# Altium project Karta_Radiowa_ILS_TETRA.PrjPcb (part 5 of 9)

## Sheet TOR ILS.SchDoc: 110 MHz
size A3; SheetNumber: 14; SheetTotal: 17
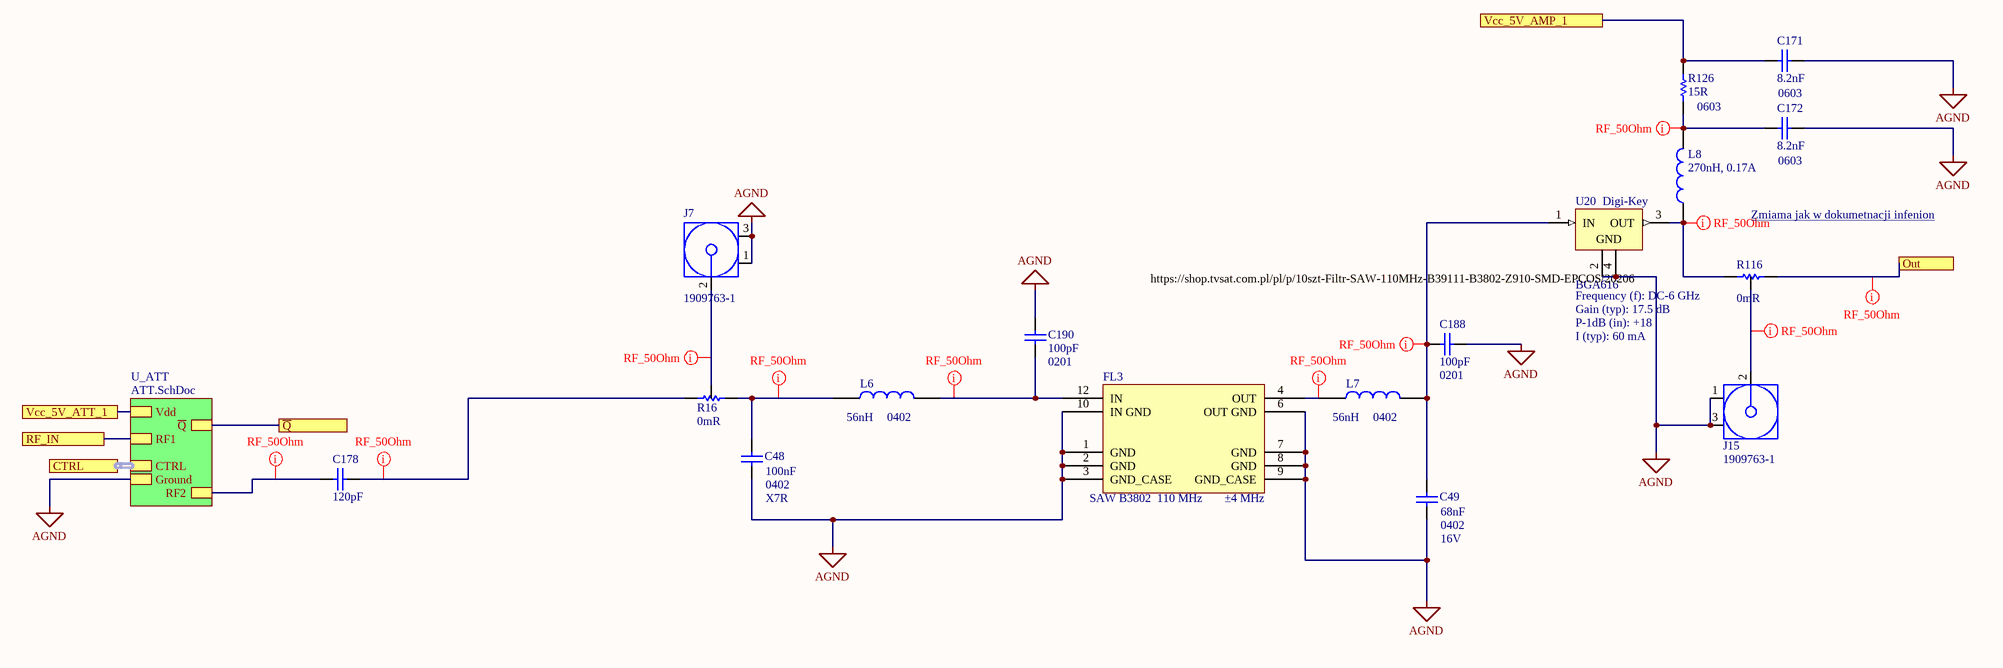
[diagram p6: TOR ILS.SchDoc]

### Parts
C48  100nF  Case/Package: 0402  Dielectric: X7R  [CAP 0402/1005 RF KK]
C49  68nF  Case/Package: 0402  Voltage Rating: 16V  [CAP 0402/1005 RF KK]
C171  8.2nF  Case/Package: 0603  [CAP 0603/1608 RF]
C172  8.2nF  Case/Package: 0603  [CAP 0603/1608 RF]
C178  120pF  [CAP 0402/1005 RF KK]
C188  100pF  Case/Package: 0201  [CAP 0201/0603 KK]
C190  100pF  Case/Package: 0201  [CAP 0201/0603 KK]
FL3  SAW B3802  Bandwidth: ±4 MHz  Center frequency: 110 MHz  [QCC12B]
J7  1909763-1  [TECO-1909763-1_V]
J15  1909763-1  [TECO-1909763-1_V]
L6  56nH  Case/Package: 0402  [FB0402]
L7  56nH  Case/Package: 0402  [FB0402]
L8  270nH, 0.17A  [WE-KI_0603]
R16  0mR  [RES 0402/1005 RF - 3-PADS]
R116  0mR  [RES 0402/1005 RF - 3-PADS]
R126  15R  Case/Package: 0603  [RES 0603/1608 RF]
U20  BGA616  Frequency (f): DC-6 GHz  Gain (typ): 17.5 dB  I (typ): 60 mA  P-1dB (in): +18  Supplier 2: Digi-Key  [INF-SOT343_V]

### Sub-sheets
U_ATT = ATT.SchDoc: Vdd, Ground, RF1, RF2, CTRL (harness ATT_Controle), ~{Q}

### Ports
CTRL, Out, RF_IN, Vcc_5V_AMP_1, Vcc_5V_ATT_1, ~{Q}

### Nets
AGND: C48.1 C49.1 C171.2 C172.2 C188.1 C190.1 FL3.1(GND) FL3.2(GND) FL3.3(GND_CASE) FL3.6(OUT_GND) FL3.7(GND) FL3.8(GND) FL3.9(GND_CASE) FL3.10(IN_GND) J7.1 J7.3 J15.1 J15.3 U20.2(GND) U20.4(GND) ; sheet U_ATT/Ground  [project net GND_ATT]
~{Q}: port ~{Q}, sheet U_ATT/~{Q}
Vcc_5V_AMP_1: C171.1 R126.2 ; port Vcc_5V_AMP_1
Vcc_5V_ATT_1: port Vcc_5V_ATT_1, sheet U_ATT/Vdd
NetC48_2: C48.2 L6.1 R16.2
NetC49_2: C49.2 C188.2 L7.2 U20.1(IN)
NetC172_1: C172.1 L8.2 R126.1
NetC175_2: R116.1 ; port Out
NetC178_1: C178.1 ; sheet U_ATT/RF2
NetC178_2: C178.2 R16.1
NetC190_2: C190.2 FL3.12(IN) L6.2
NetFL3_4: FL3.4(OUT) L7.1
NetJ7_2: J7.2 R16.3
NetJ15_2: J15.2 R116.3
NetL8_1: L8.1 R116.2 U20.3(OUT)
NetR9_U_RF_ANT_L_2: port RF_IN, sheet U_ATT/RF1

### Buses and harness runs
harness port CTRL = sheet U_ATT/CTRL

### Layout directives
net class Single50: NetC48_2, NetC49_2, NetC172_1, NetC175_2, NetC178_1, NetC178_2, NetC190_2, NetFL3_4, NetJ7_2, NetJ15_2, NetL8_1

### Notes on the sheet
- Zmiama jak w dokumetnacji infenion <https://www.infineon.com/dgdl/AN098.pdf?fileId=db3a30431441fb5d0114b6641c751744>
- https://shop.tvsat.com.pl/pl/p/10szt-Filtr-SAW-110MHz-B39111-B3802-Z910-SMD-EPCOS/20206
- Title
- Size:
- Date:
- A3
- Number:
- Time:
- Revision:
- Sheet
- of
- File:

### Library data of the parts
C48 = Capacitor: 0402 16V X7R 0.1uF 5% multilayer ceramic capacitor; Manufacturer: Murata; Manufacturer Part Number: GCM155R71C104JA55D; Supplier 1: Digi-Key; Supplier Part Number 1: 490-16433-1-ND; RoHS: Yes; Category: Ceramic Capacitors; Stock 1: 306728; Pricing 1: 1=0,10000, 10=0,05500, 50=0,02980, 100=0,02430, 500=0,01734, 1000=0,01363, 2500=0,01239, 5000=0,01140 (USD); Min Operating Temperature: -55°C; Max Operating Temperature: 125°C; Capacitance: 100nF; Tolerance: 5%; Packaging: Tape and Reel; Length: 1mm; Depth: 0.5mm; ComponentLink1URL: http://components.arrow.com/part/dataview/0323_06691671?src-supplier=Arrow+Europe; ComponentLink1Description: http://components.arrow.com/part/dataview/0323_06691671?src-supplier=Arrow+Europe; ComponentLink2URL: http://search.murata.co.jp/Ceramy/image/img/A01X/G101/ENG/GCM155R71C104JA55-01.pdf?src-supplier=Digi-Key; ComponentLink2Description: http://search.murata.co.jp/Ceramy/image/img/A01X/G101/ENG/GCM155R71C104JA55-01.pdf?src-supplier=Digi-Key; ComponentLink3URL: https://search.murata.co.jp/Ceramy/image/img/A01X/G101/ENG/GCM155R71C104JA55-01.pdf?src-supplier=Digi-Key; ComponentLink3Description: https://search.murata.co.jp/Ceramy/image/img/A01X/G101/ENG/GCM155R71C104JA55-01.pdf?src-supplier=Digi-Key
C49 = Capacitor: CAP CER 0.068UF 16V X7R 0402; Manufacturer: Yageo; Manufacturer Part Number: AC0402KRX7R7BB683; Tolerance: 10%; Supplier 1: Digi-Key; Supplier Part Number 1: 311-3269-1-ND; RoHS: No; Category: Ceramic Capacitors; Stock 1: 93171; Pricing 1: 1=0,10000, 10=0,06000, 50=0,03260, 100=0,02650, 500=0,01896, 1000=0,01490, 2500=0,01354, 5000=0,01246 (USD); Mount: Surface Mount; Min Operating Temperature: -55°C; Max Operating Temperature: 125°C; Packaging: Cut Tape; Capacitance: 68nF; Ratings: AEC-Q200; Lead Free: Lead Free; ComponentLink1URL: http://www.yageo.com/documents/recent/UPY-AC_NP0X7R_16V-to-630V_12.pdf?src-supplier=Digi-Key; ComponentLink1Description: http://www.yageo.com/documents/recent/UPY-AC_NP0X7R_16V-to-630V_12.pdf?src-supplier=Digi-Key; ComponentLink2URL: http://www.yageo.com/documents/recent/UPY-AC_NP0X7R_16V-to-630V_11.pdf?src-supplier=Digi-Key; ComponentLink2Description: http://www.yageo.com/documents/recent/UPY-AC_NP0X7R_16V-to-630V_11.pdf?src-supplier=Digi-Key
C171 C172 = Capacitor: Multilayer Ceramic Capacitors MLCC - SMD/SMT 0603 8,200pF 50volts C0G +/-5%; Manufacturer: Murata; Manufacturer Part Number: GRM1885C1H822JA01D; Voltage Rating: 50V; Tolerance: 5%; Supplier 1: Digi-Key; Supplier Part Number 1: 490-11482-1-ND; RoHS: Yes; Category: Ceramic Capacitors; Stock 1: 65615; Pricing 1: 1=0,21000, 10=0,14200, 50=0,08500, 100=0,07170, 500=0,04908, 1000=0,04341 (USD); Mount: Surface Mount; Case Code (Imperial): 0603; Case Code (Metric): 1608; Min Operating Temperature: -55°C; Max Operating Temperature: 125°C; Dielectric: C0G; Capacitance: 8.2nF; Voltage Rating (DC): 50V; Packaging: Tape and Reel; Package Quantity: 4000; Termination: SMD/SMT; Length: 0.063inch; Height: 0.8mm; Width: 0.031inch; Thickness: 0.035inch; ComponentLink1URL: https://datasheet.ciiva.com/29537/partnumbering-e-01-29537913.pdf?src-supplier=Digi-Key; ComponentLink1Description: https://datasheet.ciiva.com/29537/partnumbering-e-01-29537913.pdf?src-supplier=Digi-Key
C178 = Capacitor: CAP CER 120PF 25V C0G/NP0 0402; Manufacturer: KEMET; Manufacturer Part Number: C0402C121J3GAC7867; Tolerance: 5%; Supplier 1: Digi-Key; Supplier Part Number 1: 399-14880-1-ND; RoHS: No; Category: Ceramic Capacitors; Stock 1: 43311; Pricing 1: 1=0,10000, 10=0,04100, 50=0,02260, 100=0,01840, 500=0,01312, 1000=0,01032, 2500=0,00938, 5000=0,00863 (USD); Mount: Surface Mount; Case/Package: 0402; Case Code (Imperial): 0402; Case Code (Metric): 1005; Min Operating Temperature: -55°C; Max Operating Temperature: 125°C; Packaging: Tape and Reel; Capacitance: 120pF; Voltage Rating: 25V; ComponentLink1URL: https://api.kemet.com/component-edge/download/datasheet/C0402C121J3GAC7867.pdf?src-supplier=Digi-Key; ComponentLink1Description: https://api.kemet.com/component-edge/download/datasheet/C0402C121J3GAC7867.pdf?src-supplier=Digi-Key
C188 C190 = Capacitor: Multilayer Ceramic Capacitors MLCC - SMD/SMT 0201 100pF 25volts C0G +/-5%; Manufacturer: Murata; Manufacturer Part Number: GRM0335C1E101JA01D; Tolerance: 5%; Voltage: 25V; Supplier 1: Digi-Key; Supplier Part Number 1: 490-3160-1-ND; RoHS: Yes; Category: Ceramic Capacitors; Stock 1: 270262; Pricing 1: 1=0,10000, 10=0,01300, 100=0,00560, 500=0,00400, 1000=0,00315, 2500=0,00286, 5000=0,00263 (USD); Mount: Surface Mount; Case Code (Metric): 0603; Case Code (Imperial): 0201; Min Operating Temperature: -55°C; Max Operating Temperature: 125°C; Dielectric: C0G; Capacitance: 100pF; Termination: SMD/SMT; Package Quantity: 15000; Packaging: Tape and Reel; Voltage Rating: 25V; Voltage Rating (DC): 25V; Length: 0.6mm; Height: 0.3mm; Thickness: 0.013inch; Depth: 0.3mm; Width: 0.012inch; Radiation Hardening: No; REACH SVHC: No SVHC; Lead Free: Lead Free; ComponentLink1URL: https://datasheet.ciiva.com/16497/grm0335c1e101ja01-01-16497112.pdf?src-supplier=Future+Electronics; ComponentLink1Description: https://datasheet.ciiva.com/16497/grm0335c1e101ja01-01-16497112.pdf?src-supplier=Future+Electronics; ComponentLink2URL: https://datasheet.ciiva.com/18697/product-18697797.pdf?src-supplier=Digi-Key; ComponentLink2Description: https://datasheet.ciiva.com/18697/product-18697797.pdf?src-supplier=Digi-Key
FL3 = SAW B3802: Low-Loss Filter 110,0 MHz / TYPE: B3802 / Ordering Code: B39111-B3802-Z910; Source Power: 10 dBm; ComponentLink1Description: Datasheet; ComponentLink1URL: https://www.tvsat.com.pl/pdf/B/b39111-b3802_epc.pdf; ComponentLink2Description: Supplier; ComponentLink2URL: https://shop.tvsat.com.pl/pl/p/10szt-Filtr-SAW-110MHz-B39111-B3802-Z910-SMD-EPCOS/20206
J7 J15 = 1909763-1: Ultra Miniature Coaxial Connector Jack, 60 V, 50 Ohm, -40 to 90 degC, RoHS, Tape and Reel; Brand: TE Connectivity / AMP; Maximum Frequency: 6 GHz; Gender: Jack (Female); Body Material: Liquid Crystal Polymer (LCP); RF Series: UMCC; Impedance: 50 Ohms; DatasheetVersion: Rev. B2; PackageReference: SMD; PackageDescription: 3-Pin Surface Mount Device, Body 2.6 x 2.6 mm; Supplier 1: Newark; Supplier Part Number 1: 62X0488; Supplier 2: Farnell; Supplier Part Number 2: 2781689; Supplier 3: Digi-Key; Supplier Part Number 3: A118077TR-ND; Supplier 4: Digi-Key; Supplier Part Number 4: A118077CT-ND; Supplier 5: Digi-Key; Supplier Part Number 5: A118077DKR-ND; Product Category: RF Connectors / Coaxial Connectors; Packaging: Reel; Product: Connectors; Orientation: Straight; Operating Temperature Range: - 40 C to + 90 C; Factory Pack Quantity: 5000; RoHS: Details; Contact Plating: Gold; Contact Material: Copper Alloy; Mounting Technology: Surface Mount; ComponentLink1Description: Manufacturer URL; ComponentLink1URL: http://www.te.com; ComponentLink2Description: Datasheet; ComponentLink2URL: http://www.te.com/commerce/DocumentDelivery/DDEController?Action=srchrtrv&DocNm=1909763&DocType=Customer+Drawing&DocLang=English
L6 L7 = Inductor: MURATA - LQW15AN56NJ00D - High Frequency Inductor, 56 nH, LQW15AN_00 Series, 200 mA, 0402 [1005 Metric], Unshielded, 1.17 ohm; Core Material: Air,Ferrite; Tolerance: 5%; Current Rating: 200mA; DC Resistance (DCR): 1.17R; Test Frequency: 100MHz; Q Factor: 25; Self Resonant Frequency: 2.8GHz; Supplier 1: Digi-Key; Supplier Part Number 1: 490-1155-1-ND; Manufacturer: Murata; Manufacturer Part Number: LQW15AN56NJ00D; RoHS: Yes; Category: Fixed Inductors; Stock 1: 98942; Pricing 1: 1=0,16000, 10=0,14300, 25=0,12720, 50=0,10820, 100=0,09540, 250=0,08744, 500=0,07950, 1000=0,06678, 2500=0,05724 (USD); Mount: Surface Mount; Weight: 2.8E-05oz; Case Code (Imperial): 0402; Case Code (Metric): 1005; Min Operating Temperature: -55°C; Max Operating Temperature: 125°C; Termination: SMD/SMT; Packaging: Tape and Reel; Package Quantity: 10000; Inductance: 56nH; Max DC Current: 200mA; Composition: Wirewound; DC Current: 200mA; Military Standard: Not; Shielding: Unshielded; Length: 1mm; Height: 0.5mm; Depth: 0.6mm; Width: 0.5mm; Radiation Hardening: No; Lead Free: Lead Free; ComponentLink1URL: https://datasheet.ciiva.com/11801/0900766b8090d800-11801442.pdf?src-supplier=RSComponents; ComponentLink1Description: https://datasheet.ciiva.com/11801/0900766b8090d800-11801442.pdf?src-supplier=RSComponents; ComponentLink2URL: https://datasheet.ciiva.com/16207/l0075s0080lqw15a-00-16207914.pdf?src-supplier=Future+Electronics; ComponentLink2Description: https://datasheet.ciiva.com/16207/l0075s0080lqw15a-00-16207914.pdf?src-supplier=Future+Electronics; ComponentLink3URL: https://datasheet.ciiva.com/1042/l0075s0080lqw15a-00-1042190.pdf?src-supplier=Digi-Key; ComponentLink3Description: https://datasheet.ciiva.com/1042/l0075s0080lqw15a-00-1042190.pdf?src-supplier=Digi-Key; ComponentLink4URL: https://datasheet.ciiva.com/8506/l0075s0080lqw15a-00-8506014.pdf?src-supplier=Avnet; ComponentLink4Description: https://datasheet.ciiva.com/8506/l0075s0080lqw15a-00-8506014.pdf?src-supplier=Avnet; ComponentLink5URL: https://datasheet.ciiva.com/1042/l0075s0080lqw15a-00-1042191.pdf?src-supplier=Digi-Key; ComponentLink5Description: https://datasheet.ciiva.com/1042/l0075s0080lqw15a-00-1042191.pdf?src-supplier=Digi-Key; ComponentLink6URL: https://datasheet.ciiva.com/18088/getdatasheetpartid-26539-18088614.pdf?src-supplier=Verical; ComponentLink6Description: https://datasheet.ciiva.com/18088/getdatasheetpartid-26539-18088614.pdf?src-supplier=Verical; ComponentLink7URL: https://datasheet.ciiva.com/1042/l0075s0080lqw15a-00-1042189.pdf?src-supplier=Digi-Key; ComponentLink7Description: https://datasheet.ciiva.com/1042/l0075s0080lqw15a-00-1042189.pdf?src-supplier=Digi-Key
L8 = 744761227A: Wurth WE-KI Series Shielded Wire-wound SMD Inductor with a Ceramic Core, 270 nH 170mA Idc Q:30; Manufacturer: Wurth Elektronik; Q-Factor min.: 30; Inductance Tolerance: +/-5%; DC Resistance max.: 1.8Ohm; Self Resonant Frequency: 1000MHz; ComponentLink1Description: Manufacturer; ComponentLink1URL: http://www.we-online.de; ComponentLink2Description: Datasheet; ComponentLink2URL: https://www.we-online.com/catalog/datasheet/744761227A.pdf; Published Date: April 2020; Rated Current: 0.17A; Packaging: Tape and Reel; Operating Temperature: -40 to +125degC; Manufacturer Part Number: 744761227A; Size: 0603; Inductance: 270nH; Mounting Technology: SMT; Supplier 1: Digi-Key; Supplier Part Number 1: 732-744761227ACT-ND; RoHS: No; Category: Fixed Inductors; Stock 1: 2580; Pricing 1: 1=0,28000, 10=0,24700, 100=0,22800, 500=0,20900, 1000=0,19300 (USD)
R16 R116 = Resistor: YAGEO - RC0402JR-070RL. - RES, THICK FILM, 0R, 0.0625W, 0402; Power Rating: 62.5mW; Tolerance: 5%; Max Power Dissipation: 63mW; Temperature Coefficient: 200ppm/°C; Voltage Rating: 50V; Supplier 1: Digi-Key; Supplier Part Number 1: 311-0.0JRDKR-ND; Manufacturer: Yageo; Manufacturer Part Number: RC0402JR-070RL; RoHS: Yes; Category: Chip SMD Resistors; Stock 1: 19267045; Pricing 1: 1=0,10000, 10=0,01300, 25=0,00920, 50=0,00720, 100=0,00530, 250=0,00400, 500=0,00320, 1000=0,00236, 5000=0,00169 (USD); Case/Package: 0402; Contact Plating: Tin,Matte; Case Code (Metric): 1005; Case Code (Imperial): 0402; Min Operating Temperature: -55°C; Max Operating Temperature: 155°C; Resistance: 0mR; Packaging: Tape and Reel; Composition: Thick Film; Package Quantity: 1; Number of Terminations: 2; Termination: SMD/SMT; Military Standard: Not; Features: Moisture Resistant; Length: 1mm; Height: 0.016inch; Width: 0.02inch; Depth: 0.5mm; Radiation Hardening: No; Lead Free: Lead Free; REACH SVHC: Unknown; ComponentLink1URL: https://datasheet.ciiva.com/2452/pyu-rc0402-51-rohs-l-6-2452608.pdf?src-supplier=Digi-Key; ComponentLink1Description: https://datasheet.ciiva.com/2452/pyu-rc0402-51-rohs-l-6-2452608.pdf?src-supplier=Digi-Key; ComponentLink2URL: https://datasheet.ciiva.com/11808/0900766b80c66297-11808195.pdf?src-supplier=RSComponents; ComponentLink2Description: https://datasheet.ciiva.com/11808/0900766b80c66297-11808195.pdf?src-supplier=RSComponents; ComponentLink3URL: https://datasheet.ciiva.com/2452/pyu-r-int-thick-7-2452609.pdf?src-supplier=Digi-Key; ComponentLink3Description: https://datasheet.ciiva.com/2452/pyu-r-int-thick-7-2452609.pdf?src-supplier=Digi-Key; ComponentLink4URL: https://datasheet.ciiva.com/2452/pyu-r-int-thick-7-2452610.pdf?src-supplier=Digi-Key; ComponentLink4Description: https://datasheet.ciiva.com/2452/pyu-r-int-thick-7-2452610.pdf?src-supplier=Digi-Key; ComponentLink5URL: https://datasheet.ciiva.com/8896/pyu-rc0402-51-rohs-l-6-8896201.pdf?src-supplier=Avnet; ComponentLink5Description: https://datasheet.ciiva.com/8896/pyu-rc0402-51-rohs-l-6-8896201.pdf?src-supplier=Avnet; ComponentLink6URL: https://datasheet.ciiva.com/28386/pyu-rc0402-51-rohs-l-6-28386633.pdf?src-supplier=Avnet+Europe; ComponentLink6Description: https://datasheet.ciiva.com/28386/pyu-rc0402-51-rohs-l-6-28386633.pdf?src-supplier=Avnet+Europe; ComponentLink7URL: https://datasheet.ciiva.com/22747/1018594-22747515.pdf?src-supplier=Element14; ComponentLink7Description: https://datasheet.ciiva.com/22747/1018594-22747515.pdf?src-supplier=Element14; ComponentLink8URL: https://datasheet.ciiva.com/15189/getdatasheetpartid-326379-15189533.pdf?src-supplier=Verical; ComponentLink8Description: https://datasheet.ciiva.com/15189/getdatasheetpartid-326379-15189533.pdf?src-supplier=Verical; ComponentLink9URL: https://datasheet.ciiva.com/7983/1018594-7983535.pdf?src-supplier=Element14; ComponentLink9Description: https://datasheet.ciiva.com/7983/1018594-7983535.pdf?src-supplier=Element14
R126 = Resistor: RES SMD 15 OHM 0.5% 1/16W 0603; Manufacturer: Susumu; Manufacturer Part Number: RR0816Q-150-D; Power Rating: 63mW; Voltage Rating: 75V; Temperature Coefficient: 50ppm/°C; Supplier 1: Digi-Key; Supplier Part Number 1: RR08Q15DCT-ND; RoHS: Yes; Category: Chip SMD Resistors; Stock 1: 15480; Pricing 1: 1=0,10000, 10=0,09300, 100=0,03580, 1000=0,01575, 2500=0,01360 (USD); Number of Pins: 2; Case Code (Imperial): 0603; Case Code (Metric): 1608; Min Operating Temperature: -55°C; Max Operating Temperature: 125°C; Resistance: 15R; Packaging: Tape and Reel; Tolerance: 0.5%; Package Quantity: 1; Termination: SMD/SMT; Resistor Type: Thin Film; Number of Terminations: 2; Max Power Dissipation: 63mW; Voltage Rating (DC): 75V; Length: 1.6mm; Height: 0.4mm; Width: 0.8mm; Depth: 0.8mm; REACH SVHC: Unknown; Lead Free: Lead Free; ComponentLink1URL: https://datasheet.ciiva.com/11820/0900766b80808d64-11820652.pdf?src-supplier=RSComponents; ComponentLink1Description: https://datasheet.ciiva.com/11820/0900766b80808d64-11820652.pdf?src-supplier=RSComponents; ComponentLink2URL: https://datasheet.ciiva.com/2497/rr-data-sheet-2497981.pdf?src-supplier=Digi-Key; ComponentLink2Description: https://datasheet.ciiva.com/2497/rr-data-sheet-2497981.pdf?src-supplier=Digi-Key; ComponentLink3URL: https://datasheet.ciiva.com/2497/rr-data-sheet-2497982.pdf?src-supplier=Digi-Key; ComponentLink3Description: https://datasheet.ciiva.com/2497/rr-data-sheet-2497982.pdf?src-supplier=Digi-Key; ComponentLink4URL: https://datasheet.ciiva.com/2497/rr-data-sheet-2497983.pdf?src-supplier=Digi-Key; ComponentLink4Description: https://datasheet.ciiva.com/2497/rr-data-sheet-2497983.pdf?src-supplier=Digi-Key
U20 = BGA616: Silicon Germanium Broadband MMIC Amplifier, DC-6 GHz, 17.5 dB Gain, SOT343, Green; Manufacturer: Infineon; F (typ): 2.9 dB; Green: yes; DatasheetVersion: Rev. 2.1; PackageReference: SOT343; PackageDescription: 4-Pin Small Outline Transistor Package, 1.25 x 2 mm Body; Supplier 1: Mouser; Supplier Part Number 1: N/A; Halogen-free: yes; Mounting Technology: Surface Mount; PartNumber: BGA616; ComponentLink1Description: Manufacturer URL; ComponentLink1URL: http://www.infineon.com/; ComponentLink2Description: Datasheet; ComponentLink2URL: http://www.infineon.com/dgdl/BGA616.pdf?folderId=db3a30431441fb5d0114b654e6581730&fileId=db3a304314dca3890115419102bb163b&location=en.Products.RF.RF_MMIC.CATV___Broadband_Amplifier.DATASHEET.BGA616.pdf; ComponentLink3Description: Package Specification; ComponentLink3URL: http://www.infineon.com/dgdl/SOT343-Package_Overview.pdf?folderId=db3a30431936bc4b0119535155343cba&fileId=db3a30431936bc4b0119535a9f393cd3; Supplier Part Number 2: BGA616H6327XTSA1CT-ND

## Sheet ATT.SchDoc: Attanuator
size A3; SheetNumber: 15; SheetTotal: 17
Used 2 times, as channels U_RF_LANES/U_TOR ILS/U_ATT, U_RF_LANES/U_Tor_330MHz/U_ATT. Parts and nets are listed once, with the designators drawn on the sheet.
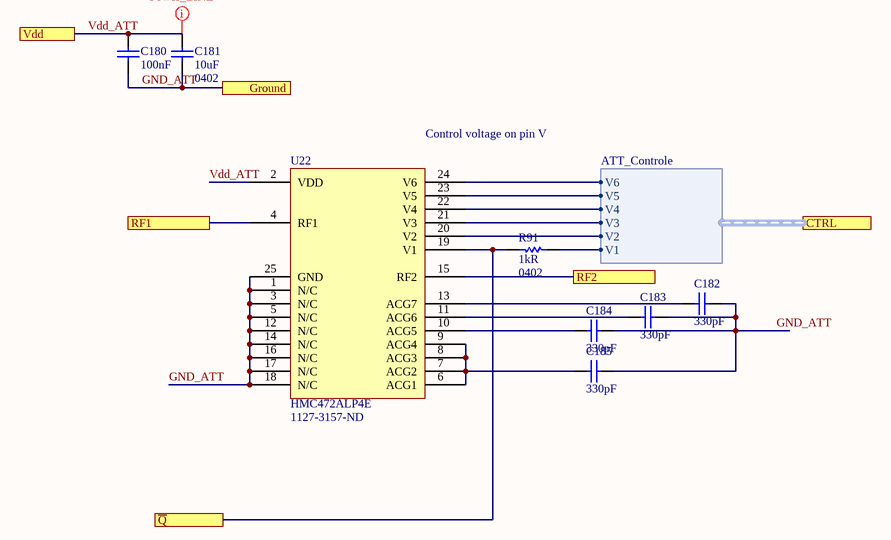
[diagram p7: ATT.SchDoc]

### Parts
C180  100nF  [CAP 0201/0603 KK]
C181  10uF  Case/Package: 0402  [CAP 0402/1005 RF KK]
C182  330pF  [CAP 0402/1005 RF KK]
C183  330pF  [CAP 0402/1005 RF KK]
C184  330pF  [CAP 0402/1005 RF KK]
C185  330pF  [CAP 0402/1005 RF KK]
R91  1kR  Case/Package: 0402  [RES 0402/1005 RF KK]
U22  HMC472ALP4E  Supplier Part Number 1: 1127-3157-ND  [HMC472ALP4E]

### Ports
CTRL (harness ATT_Controle), Ground, RF1, RF2, Vdd, ~{Q}

### Harnesses
ATT_Controle: V1, V2, V3, V4, V5, V6

### Nets
GND_ATT: C180.1 C181.1 C182.2 C183.2 C184.2 C185.2 U22.1(N/C) U22.3(N/C) U22.5(N/C) U22.12(N/C) U22.14(N/C) U22.16(N/C) U22.17(N/C) U22.18(N/C) U22.25(GND) ; port Ground
~{Q}: R91.1 U22.19(V1) ; port ~{Q}
RF1: U22.4(RF1) ; port RF1
RF2: U22.15(RF2) ; port RF2
Vdd_ATT: C180.2 C181.2 U22.2(VDD) ; port Vdd
NetC182_1: C182.1 U22.13(ACG7)
NetC183_1: C183.1 U22.11(ACG6)
NetC184_1: C184.1 U22.10(ACG5)
NetC185_1: C185.1 U22.6(ACG1) U22.7(ACG2) U22.8(ACG3) U22.9(ACG4)
NetR91_2: R91.2 ; port CTRL.V1
NetU22_20: U22.20(V2) ; port CTRL.V2
NetU22_21: U22.21(V3) ; port CTRL.V3
NetU22_22: U22.22(V4) ; port CTRL.V4
NetU22_23: U22.23(V5) ; port CTRL.V5
NetU22_24: U22.24(V6) ; port CTRL.V6

### Channels
U_RF_LANES/U_TOR ILS/U_ATT: designators end in _U_ATT1; ports Ground=GND_ATT RF1=NetR9_U_RF_ANT_L_2 RF2=NetC178_1 Vdd=Vcc_5V_ATT_1 ~{Q}=~{Q}
U_RF_LANES/U_Tor_330MHz/U_ATT: designators end in _U_ATT2; ports Ground=GND_ATT RF1=NetR9_U_RF_ANT_M_2 RF2=NetC173_1 Vdd=Vcc_5V_ATT_2 ~{Q}=~{Q}

### Layout directives
net class Power_LINE: Vcc_5V_ATT_1

### Notes on the sheet
- (near U22) Control voltage on pin V
- Title
- Size:
- Date:
- A3
- Number:
- Time:
- Revision:
- Sheet
- of
- File:

### Library data of the parts
C180 = Capacitor: Manufacturer 1: Murata; Manufacturer Part Number 1: GRM033R61C104ME84D; Voltage Rating: 16V; Tolerance: 20%; Dielectric: X5R; Supplier 1: Digi-Key; Supplier Part Number 1: 490-9986-1-ND; Stock 1: 550070; Pricing 1: 1=0.10000, 10=0.05400, 100=0.02430, 500=0.01732, 1000=0.01361, 2500=0.01238, 5000=0.01139 (USD); RoHS: Yes; Mount: Surface Mount; Case/Package: 0201; Weight: 1.2E-05oz; Case Code (Metric): 0603; Case Code (Imperial): 0201; Min Operating Temperature: -55°C; Max Operating Temperature: 85°C; Capacitance: 100nF; Packaging: Tape and Reel; Termination: SMD/SMT; Voltage Rating (DC): 16V; Package Quantity: 15000; Length: 0.024inch; Height: 0.3mm; Width: 0.3mm; Thickness: 0.013inch; ComponentLink1URL: http://www.mouser.com/ds/2/281/c02e-2905.pdf?src-supplier=Mouser; ComponentLink1Description: http://www.mouser.com/ds/2/281/c02e-2905.pdf?src-supplier=Mouser; ComponentLink2URL: http://search.murata.co.jp/Ceramy/image/img/A01X/G101/ENG/GRM033R61C104ME84-01.pdf?src-supplier=Digi-Key; ComponentLink2Description: http://search.murata.co.jp/Ceramy/image/img/A01X/G101/ENG/GRM033R61C104ME84-01.pdf?src-supplier=Digi-Key
C181 = Capacitor: CAP CER 10UF 6.3V X5R 0402; Manufacturer: Murata; Manufacturer Part Number: GRJ155R60J106ME11D; Tolerance: 20%; Supplier 1: Digi-Key; Supplier Part Number 1: 490-13211-1-ND; RoHS: Yes; Category: Ceramic Capacitors; Stock 1: 1136490; Pricing 1: 1=0,21000, 10=0,14500, 50=0,08680, 100=0,07330, 500=0,05016, 1000=0,04436, 2500=0,04244, 5000=0,03858 (USD); Mount: Surface Mount; Case Code (Metric): 1005; Case Code (Imperial): 0402; Min Operating Temperature: -55°C; Max Operating Temperature: 85°C; Packaging: Cut Tape; Capacitance: 10uF; Voltage Rating: 6.3V; Features: Soft Termination; Length: 0.039inch; Width: 0.02inch; Thickness: 0.028inch; ComponentLink1URL: http://psearch.en.murata.com/capacitor/product/GRJ155R60J106ME11%23.pdf?src-supplier=Digi-Key; ComponentLink1Description: http://psearch.en.murata.com/capacitor/product/GRJ155R60J106ME11%23.pdf?src-supplier=Digi-Key
C182-C185 = Capacitor: Manufacturer 1: Walsin Technologies; Manufacturer Part Number 1: 0402N331F500CT; Tolerance: 1%; Dielectric: C0G; Supplier 1: Digi-Key; Supplier Part Number 1: 1292-1307-1-ND; Stock 1: 23341; Pricing 1: 1=0.12000, 10=0.09000, 100=0.04030, 500=0.02876, 1000=0.02260, 2500=0.02054, 5000=0.01890 (USD); RoHS: Yes; Case/Package: 0402; Min Operating Temperature: -55°C; Max Operating Temperature: 125°C; Packaging: Tape and Reel; Capacitance: 330pF; Length: 1mm; Depth: 0.5mm; ComponentLink1URL: http://components.arrow.com/part/dataview/0323_06535843?src-supplier=Arrow+Europe; ComponentLink1Description: http://components.arrow.com/part/dataview/0323_06535843?src-supplier=Arrow+Europe; ComponentLink2URL: http://www.passivecomponent.com/indexsea/0402N331F500CT-IN.pdf?src-supplier=Digi-Key; ComponentLink2Description: http://www.passivecomponent.com/indexsea/0402N331F500CT-IN.pdf?src-supplier=Digi-Key
R91 = Resistor: Manufacturer 1: Yageo; Manufacturer Part Number 1: RC0402FR-071KL; Tolerance: 1%; Temperature Coefficient: 100ppm/°C; Power Rating: 62.5mW; Voltage Rating: 50V; Supplier 1: Digi-Key; Supplier Part Number 1: 311-1.00KLRCT-ND; Stock 1: 57541929; Pricing 1: 1=0,10000, 10=0,01600, 100=0,00640, 1000=0,00289, 2500=0,00251, 5000=0,00207 (USD); RoHS: Yes; Number of Pins: 2; Case Code (Imperial): 0402; Case Code (Metric): 1005; Min Operating Temperature: -55°C; Max Operating Temperature: 155°C; Packaging: Tape and Reel; Resistance: 1kR; Composition: Thick Film; Voltage Rating (DC): 50V; Termination: SMD/SMT; Military Standard: Not; Length: 1mm; Height: 0.32mm; Width: 0.5mm; Depth: 0.5mm; REACH SVHC: Unknown; Lead Free: Lead Free; ComponentLink1URL: https://datasheet.ciiva.com/11819/0900766b80c66297-11819477.pdf?src-supplier=RSComponents; ComponentLink1Description: https://datasheet.ciiva.com/11819/0900766b80c66297-11819477.pdf?src-supplier=RSComponents; ComponentLink2URL: https://datasheet.ciiva.com/12666/pyu-rc0402-51-rohs-l-6-r-12666741.pdf?src-supplier=Mouser; ComponentLink2Description: https://datasheet.ciiva.com/12666/pyu-rc0402-51-rohs-l-6-r-12666741.pdf?src-supplier=Mouser; ComponentLink3URL: https://datasheet.ciiva.com/17063/pyu-rc0402-51-rohs-l-6-r-17063193.pdf?src-supplier=Future+Electronics; ComponentLink3Description: https://datasheet.ciiva.com/17063/pyu-rc0402-51-rohs-l-6-r-17063193.pdf?src-supplier=Future+Electronics; ComponentLink4URL: https://datasheet.ciiva.com/22747/1018594-22747513.pdf?src-supplier=Element14; ComponentLink4Description: https://datasheet.ciiva.com/22747/1018594-22747513.pdf?src-supplier=Element14; ComponentLink5URL: https://datasheet.ciiva.com/7849/1018594-7849869.pdf?src-supplier=Element14; ComponentLink5Description: https://datasheet.ciiva.com/7849/1018594-7849869.pdf?src-supplier=Element14; ComponentLink6URL: https://datasheet.ciiva.com/7983/1018594-7983502.pdf?src-supplier=Element14; ComponentLink6Description: https://datasheet.ciiva.com/7983/1018594-7983502.pdf?src-supplier=Element14; ComponentLink7URL: https://datasheet.ciiva.com/7849/1018594-7849871.pdf?src-supplier=Element14; ComponentLink7Description: https://datasheet.ciiva.com/7849/1018594-7849871.pdf?src-supplier=Element14
U22 = HMC472ALP4E: ANALOG DEVICES   HMC472ALP4E   RF ATTENUATOR, 3.8GHZ, 5.5V, HQFN-24; Min Supply Voltage: 4.5V; Attenuation Value: 31.5dB; Impedance: 50R; Max Power Dissipation: 560mW; Number of Bits: 6; Number of Channels: 1; Insertion Loss: 3dB; Operating Supply Voltage: 5V; Supplier 1: Digi-Key; Manufacturer: Analog Devices; Manufacturer Part Number: HMC472ALP4E; Stock 1: 867; Pricing 1: 1 = 7,47000, 10 = 6,84400, 25 = 6,22160, 100 = 5,59940, 250 = 5,13284, 500 = 4,66620, 1000 = 4,19958 (USD); RoHS: Yes; Mount: Surface Mount; Case/Package: SMD/SMT; Number of Pins: 24; Contact Plating: Tin,Matte; Min Operating Temperature: -40°C; Max Operating Temperature: 85°C; Max Supply Voltage: 5.5V; Packaging: Cut Tape; Max Frequency: 3.8GHz; Package Quantity: 50; Min Input Voltage: 4.5V; Max Input Voltage: 5.5V; REACH SVHC: No SVHC; Lead Free: Contains Lead; ComponentLink1URL: http://www.mouser.com/ds/2/609/hmc472a-879296.pdf?src-supplier=Mouser; ComponentLink1Description: http://www.mouser.com/ds/2/609/hmc472a-879296.pdf?src-supplier=Mouser; ComponentLink2URL: http://www.analog.com/media/en/technical-documentation/data-sheets/hmc472a.pdf?src-supplier=Avnet+Asia; ComponentLink2Description: http://www.analog.com/media/en/technical-documentation/data-sheets/hmc472a.pdf?src-supplier=Avnet+Asia; ComponentLink3URL: http://www.farnell.com/datasheets/1868224.pdf?src-supplier=Element14; ComponentLink3Description: http://www.farnell.com/datasheets/1868224.pdf?src-supplier=Element14; ComponentLink4URL: https://www.hittite.com/content/documents/data_sheet/hmc472alp4.pdf?src-supplier=Avnet; ComponentLink4Description: https://www.hittite.com/content/documents/data_sheet/hmc472alp4.pdf?src-supplier=Avnet; ComponentLink5URL: https://www.analog.com/media/en/technical-documentation/data-sheets/hmc472a.pdf?src-supplier=Digi-Key; ComponentLink5Description: https://www.analog.com/media/en/technical-documentation/data-sheets/hmc472a.pdf?src-supplier=Digi-Key